# EasyEDA Pro project esp-college-project_bkymsryt-aeef78a5.epro, board PCB-ShuttleBoard-BMI270&BMM350-V1_2
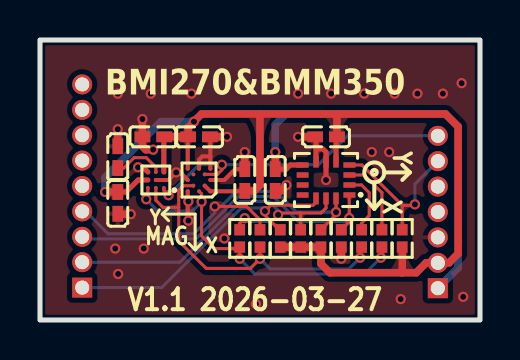
[diagram p5: board, top side]
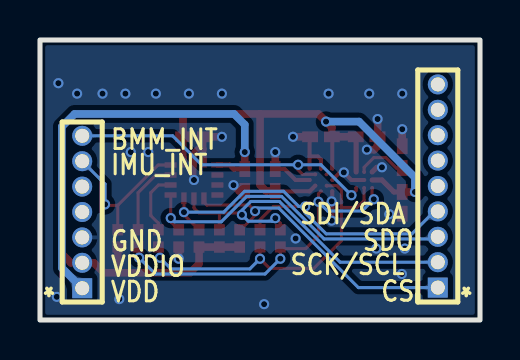
[diagram p6: board, bottom side, seen from below]

Outline 22 x 14 mm; copper layers: Top Layer, Bottom Layer. Coordinates in mm from the lower left corner of the outline.
Outline path: rectangle 22,0 0,14
Stack: Top Layer 0.035mm / Dielectric1 0.91mm FR4 er 4.5 / Bottom Layer 0.035mm

## Design rules (mm)
spacing copperThickness1oz (default): track to track 0.102, other pairs 0.102 to 0.3
spacing copperThickness2oz: track to track 0.203, other pairs 0.152 to 0.3
spacing Plane_innerPlane: track to track 0.102, other pairs 0.102 to 0.3
spacing Copper_copperRegion: track to track 0.102, other pairs 0.102 to 0.3
track width copperThickness1oz (default): min 0.102, default 0.152, max 2.54
track width copperThickness2oz: min 0.203, default 0.254, max 2.54
track width power: min 0.127, default 0.381, max 2.54
differential pair differentialPair (default): width min 0.127, default 0.254, max 2.54; gap min 0.152, default 0.152
net VDDIO uses power
net GND uses power
net VDD uses power
pour e264 uses Copper_copperRegion
pour e270 uses Copper_copperRegion

## Placement (name value [footprint] x y rotation side)
C1  100nF  [C0402]  7.95 9.16 180 top
C2  2.2uF  [C0402]  3.89 8.14 90 top
C3  100nF  [C0402]  14.3 9.16 0 top
C4  100nF  [C0402]  10.24 7 270 top
C5  100nF  [C0402]  3.89 5.86 90 top
C6  100nF  [C0402]  5.67 9.16 0 top
C7  100nF  [C0402]  11.76 7 90 top
H1  HX PZ1.27-1x9P ZZ  [HDR-TH_9P-P1.27-V-M]  2.11 6.7 90 bottom
H2  ZX-PZ1.27-1-7PZZ  [HDR-TH_7P-P1.27-V-M-2]  19.89 5.4 90 bottom
R1  100kΩ  [R0402_1]  15.06 4.08 90 top
R2  0Ω(NC)  [R0402_1]  16.08 4.08 270 top
R3  4.7kΩ(NC)  [R0402]  14.05 4.08 90 top
R4  4.7kΩ(NC)  [R0402]  13.03 4.08 90 top
R5  100kΩ  [R0402_1]  18.11 4.08 90 top
R6  0Ω(NC)  [R0402_1]  17.1 4.08 270 top
R7  10kΩ  [R0402_1]  12.02 4.08 270 top
R9  0Ω  [R0402_1]  9.98 4.08 270 top
R11  0Ω  [R0402_1]  11 4.08 270 top
U1  BMI270  [LGA-14_L3.0-W2.5-P0.50-BR]  14.3 7 0 top
U2  BMM150(NC)  [WLCSP-12_L1.6-W1.6_BMM150]  7.95 7 270 top
U3  BMM350  [WLCSP-9_L1.3-W1.3-R3-C3-P0.40-TL]  5.79 7 180 top

## Footprints (pads in the part's own frame, mm; a bottom-side part is the same pattern mirrored in y, then rotated)
C0402
  rect 0.79x0.54 smd: 1(-0.545,0) 2(0.545,0)
HDR-TH_7P-P1.27-V-M-2
  rect 1x1 hole 0.7: 1(-3.81,0)
  round 1 hole 0.7: 2(-2.54,0) 3(-1.27,0) 4(0,0) 5(1.27,0) 6(2.54,0) 7(3.81,0)
HDR-TH_9P-P1.27-V-M
  rect 1x1 hole 0.7: 1(-5.08,0)
  round 1 hole 0.7: 2(-3.81,0) 3(-2.54,0) 4(-1.27,0) 5(0,0) 6(1.27,0) 7(2.54,0) 8(3.81,0) 9(5.08,0)
LGA-14_L3.0-W2.5-P0.50-BR
  rect 0.6x0.27 smd: 1(1.17,-0.75) 2(1.17,-0.25) 3(1.17,0.25) 4(1.17,0.75) 8(-1.17,0.75) 9(-1.17,0.25) 10(-1.17,-0.25) 11(-1.17,-0.75)
  rect 0.27x0.6 smd: 5(0.5,0.92) 6(0,0.92) 7(-0.5,0.92) 12(-0.5,-0.92) 13(0,-0.92) 14(0.5,-0.92)
R0402
  rect 0.566x0.54 smd: 1(-0.433,0) 2(0.433,0)
R0402_1
  rect 0.566x0.54 smd: 1(-0.433,0) 2(0.433,0)
WLCSP-9_L1.3-W1.3-R3-C3-P0.40-TL
  round 0.2 smd: A1(-0.4,0.4) A2(0,0.4) A3(0.4,0.4) B1(-0.4,0) B2(0,0) B3(0.4,0) C1(-0.4,-0.4) C2(0,-0.4) C3(0.4,-0.4)
WLCSP-12_L1.6-W1.6_BMM150
  round 0.2 smd: A1(0.566,0.566) A3(0.566,0) A5(0.566,-0.566) B2(0.283,0.283) B4(0.283,-0.283) C1(0,0.566) C5(0,-0.566) D2(-0.283,0.283) D4(-0.283,-0.283) E1(-0.566,0.566) E3(-0.566,0) E5(-0.566,-0.566)

## Nets
As in the schematic.

Pads without a net: H1 5 6 7 8 9; H2 4 5; U1 9 10 11; U2 D4

## Via types
v1: diameter 0.508, hole 0.305, Top Layer to Bottom Layer, 51 vias

## Routing (per net, layer and track width the routed paths; a pad name or vN(x,y) marks a point on that pad's centre or on a via; arc(x,y) is an arc through that point)
GND: length 19.1
  Top Layer w0.203: U2.C5 7,7.38 v1(6.81,7.38) 6.43,7 U3.B1 U3.B2 ; v1(7.42,4.97) 7.39,5 U2.A5 ; U2.E1 8.52,8.18 ; 8.52,8.18 8.11,8.18 7.95,8.02 U2.E3 ; 8.52,8.18 8.52,9.14 C1.1 ; U2.C1 9.22,7 9.77,7.55 C4.1
  Top Layer w0.254: U1.7 13.8,8.55 ; 13.8,8.55 14.15,8.55 14.3,8.4 U1.6 v1(14.3,7) ; 13.8,8.55 13.8,9.11 C3.1 ; v1(4.9,7.64) 5.16,7.64 U3.C3
  Top Layer w0.381: C1.1 v1(9.35,9.16) ; v1(4.54,5.29) 3.91,5.29 C5.1 ; v1(5.66,8.52) 5.29,8.52 5.12,8.69 C6.1 v1(5.12,10.05) ; v1(12.32,6.74) 12.04,6.45 C7.1 ; C2.2 v1(3.89,9.54) ; C4.1 v1(10.24,8.4) ; C3.1 v1(12.91,9.16) ; R1.1 v1(15.06,3.06)
  vias: v1(3.76,3.57) v1(3.89,11.32) v1(3.91,2.3) v1(5.19,3.57) v1(5.54,11.32) v1(7.42,5.93) v1(7.57,11.32) v1(9.22,4.08) v1(10.79,0.79) v1(12.91,11.32) v1(14.56,11.32) v1(16.21,11.32) v1(16.59,8.4) v1(17.46,8.4) v1(17.73,11.32) v1(18.03,1.05) v1(18.87,11.32) v1(20.14,11.32) v1(21.08,11.84) v1(21.16,1.16)
VDD: length 21.8
  Top Layer w0.254: U1.8 12.51,7.75 12.31,7.55 C7.2
  Top Layer w0.381: C7.2 v1(11.76,8.4)
  Bottom Layer w0.381: H2.1 20.91,2.61 20.91,9.67 20.27,10.3 12.3,10.3 11.76,9.77 v1(11.76,8.4)
VDDIO: length 54.6
  Top Layer w0.203: 8.24,6.72 U2.A1 10.22,6.43 ; U2.E5 7.39,9.14 C1.2
  Top Layer w0.254: C5.2 4.31,6.4 4.9,7 U3.B3 ; U1.5 14.8,9.11 14.85,9.16 ; U3.C1 6.19,9.14
  Top Layer w0.381: R5.1 18.11,2.37 18.11,2.36 ; 14.85,10.3 20.27,10.3 20.91,9.67 20.91,3.32 20.45,2.86 H2.2 19.31,2.86 18.81,2.36 18.11,2.36 ; 14.85,10.3 14.85,10.3 14.85,9.16 ; 14.85,10.3 8.08,10.3 v1(7.7,9.92) 7.41,9.63 C1.2 6.21,9.16 ; 11,10.3 11,6.74 10.71,6.45 C4.2 ; R7.2 R4.1 R3.1 14.05,2.81 14.49,2.36 18.11,2.36 ; C5.2 v1(3.25,6.4)
  Bottom Layer w0.381: v1(7.7,9.92) 6.05,9.92 3.25,7.13 v1(3.25,6.4)
A_SCL: length 17.1
  Top Layer w0.152: U3.A3 5.39,6.12 v1(5.31,6.04) ; v1(9.98,3.06) R9.2 9.91,3.57 8.71,3.57 8.08,4.21 v1(8.08,5.91) 8.08,6.31 U2.A3 ; R6.2 17.1,3.17 v1(17.04,3.11)
  Bottom Layer w0.152: v1(17.04,3.11) 16.23,2.3 10.75,2.3 v1(9.98,3.06) ; v1(5.31,6.04) 5.9,5.45 7.62,5.45 v1(8.08,5.91)
A_SDA: length 16.7
  Top Layer w0.152: U2.B4 7.67,6.71 7.16,6.71 6.94,6.49 6.94,5.64 ; 6.94,5.64 6.93,5.63 6.15,5.63 5.79,5.98 U3.A2 ; 6.94,5.64 6.94,3.95 8.31,2.58 10.52,2.58 v1(11,3.06) R11.2 ; R2.2 16,3.57 v1(16,3.11)
  Bottom Layer w0.152: v1(11,3.06) 11.51,2.56 15.45,2.56 v1(16,3.11)
BMM_INT: length 16.4
  Top Layer w0.152: 8.24,7.28 8.87,7.28 9.09,7.51 v1(9.09,7.76) ; U3.A1 6.19,6.47 v1(6.43,6.24)
  Bottom Layer w0.152: H2.7 15.37,9.21 13.92,7.76 v1(9.09,7.76) 7.95,7.76 v1(6.43,6.24)
CS: length 15.1
  Top Layer w0.152: R7.1 11.96,4.51 11.25,5.23 v1(11.25,5.44) 11.54,5.74 13.66,5.74 13.8,5.88 U1.12
  Bottom Layer w0.152: v1(11.25,5.44) 11.09,5.6 10.06,5.6 6.08,1.62 H1.1
IMU_INT: length 8
  Top Layer w0.152: 18.11,5.73 16.09,7.75 U1.4 ; 18.11,5.73 R5.2 ; 18.11,5.73 18.69,5.73 v1(18.75,5.78)
  Bottom Layer w0.152: v1(18.75,5.78) 18.75,6.8 H2.6
SCK/SCL: length 17.9
  Top Layer w0.152: v1(11.91,5.26) 12,5.35 13.03,5.35 ; 13.03,5.35 14.05,5.35 14.3,5.6 U1.13 ; 13.03,5.35 R4.2 ; R9.1 9.98,4.84 v1(10.24,5.09)
  Bottom Layer w0.152: v1(10.24,5.09) 10.39,4.94 11.59,4.94 v1(11.91,5.26) 11.91,5.48 11.46,5.93 10.03,5.93 6.99,2.89 H1.2
SDI/SDA: length 19.6
  Top Layer w0.152: R3.2 14.8,5.27 v1(14.8,5.39) U1.14 ; R11.1 11,5.01 10.33,5.68 v1(8.74,5.68)
  Bottom Layer w0.152: v1(14.8,5.39) 12.81,5.39 11.77,6.43 9.82,6.43 9.06,5.68 v1(8.74,5.68) 8.74,5.36 7.69,4.31 3.41,4.31 2.28,5.43 H1.4
SDO: length 16.8
  Top Layer w0.152: R1.2 15.46,4.91 v1(15.46,5.09) 15.46,6.24 U1.1
  Bottom Layer w0.152: H1.3 2.22,4.05 7.8,4.05 9.92,6.18 11.67,6.18 12.94,4.91 15.28,4.91 v1(15.46,5.09)
$1N576: length 3.8
  Top Layer w0.152: R6.1 17.1,6.36 16.21,7.25 U1.3
$1N584: length 3.2
  Top Layer w0.152: R2.1 16.08,4.84 16.46,5.22 16.46,6.36 16.08,6.75 U1.2
$1N2196: length 2.6
  Top Layer w0.152: C2.1 4.19,7.6 4.7,8.12 5.31,8.12 5.79,7.64 U3.C2

## Copper pours and planes (outline as drawn; the poured copper is in the pictures)
GND on Top Layer: 0,14 22,14 22,0 0,0
GND on Bottom Layer: 0,14 22,14 22,0 0,0

Small or netless copper shapes (teardrops, artwork), in the pictures only: 82 on Top Layer, 23 on Bottom Layer

## Text on the board
Bottom Silkscreen Layer: * | CS | SDO | SDI/SDA | SCK/SCL | BMM_INT | IMU_INT | GND | VDDIO | VDD
Top Silkscreen Layer: Y | X | MAG | V1.1 2026-03-27 | BMI270&BMM350
